# EasyEDA Pro project EVA_RT.eprj, board VISION_2_X12_4S_PCB
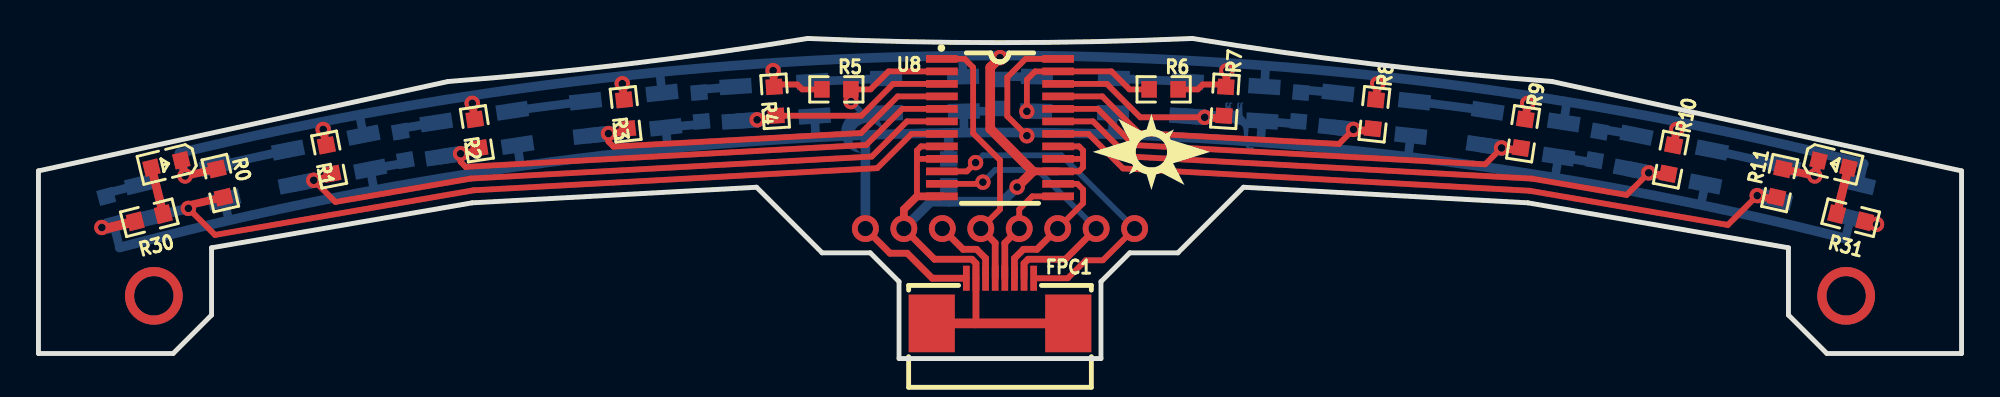
[diagram p4: board, top side]
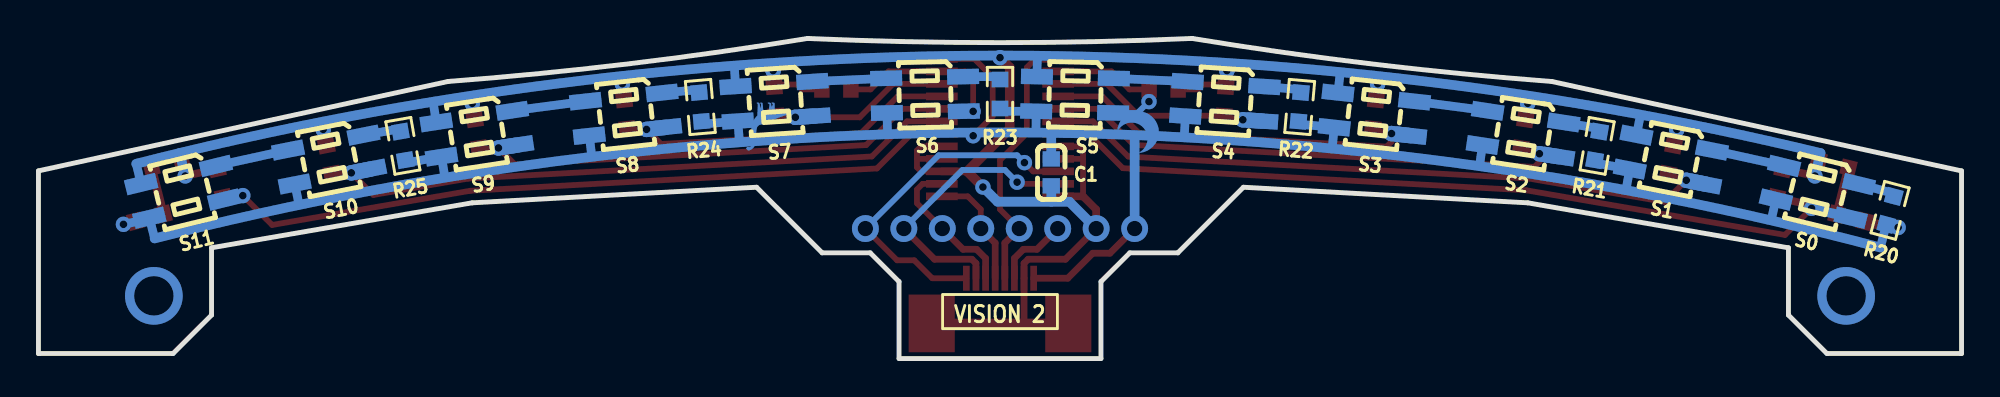
[diagram p5: board, bottom side, seen from below]

Outline 100 x 16.65 mm; copper layers: Top Layer, Bottom Layer. Coordinates in mm from the lower left corner of the outline.
Outline path: 0,0.26 0,9.76 21.3,14.41 arc(30.67,15.33) 40,16.65 arc(50,16.43) 60,16.65 arc(69.33,15.33) 78.7,14.41 100,9.76 100,0.26 93,0.26 91,2.26 91,5.76 77.45,8.1 62.66,8.91 59.25,5.5 56.75,5.5 55.25,4 55.25,0 44.75,0 44.75,4 43.25,5.5 40.75,5.5 37.34,8.91 22.55,8.1 9,5.76 9,2.26 7,0.26 0,0.26
Stack: Top Layer 0.035mm - / Dielectric1 1.51mm FR4 er 4.5 / Bottom Layer 0.035mm -

## Design rules (mm)
template: JLCPCB Capability(Two Layers Board)
spacing copperThickness1oz (default): track to track 0.102, other pairs 0.152 to 0.3
spacing copperThickness2oz: track to track 0.203, other pairs 0.152 to 0.3
track width copperThickness1oz (default): min 0.127, default 0.254, max 2.54
track width copperThickness2oz: min 0.203, default 0.254, max 2.54
differential pair differentialPair (default): width min 0.127, default 0.254, max 2.54; gap min 0.152, default 0.152
via viaSize (default): diameter min 0.5, default 0.61, max 10; hole min 0.3, default 0.305, max 6.3

## Placement (name value [footprint] x y rotation side)
C1  100nF  [C0603]  47.33 9.68 90 bottom
FPC1  FFC05001-08SBA124W5M  [FFC-SMD_FFC05001-08SBA124W5M]  50 3 0 top
LED1  XL-1608SURC-06  [LED0603-RD_RED]  6.65 10.12 193.7 top
LED2  XL-1608SURC-06  [LED0603-RD_RED]  93.34 10.11 346.3 top
R0  47kΩ  [R0603]  9.45 9.13 103.1 top
R1  47kΩ  [R0603]  15.11 10.35 101.2 top
R2  47kΩ  [R0603]  22.8 11.69 98.7 top
R3  47kΩ  [R0603]  30.53 12.71 96.2 top
R4  47kΩ  [R0603]  38.31 13.38 93.7 top
R5  47kΩ  [R0603]  41.49 14 180 top
R6  47kΩ  [R0603]  58.51 14 0 top
R7  47kΩ  [R0603]  61.69 13.38 86.3 top
R8  47kΩ  [R0603]  69.47 12.71 83.8 top
R9  47kΩ  [R0603]  77.2 11.69 81.3 top
R10  47kΩ  [R0603]  84.88 10.35 78.8 top
R11  47kΩ  [R0603]  90.55 9.13 77.6 top
R20  100Ω  [R0603]  3.72 7.71 104.9 bottom
R21  100Ω  [R0603]  18.95 11.06 99.9 bottom
R22  100Ω  [R0603]  34.42 13.09 95 bottom
R23  100Ω  [R0603]  50 13.76 90 bottom
R24  100Ω  [R0603]  65.58 13.09 85 bottom
R25  100Ω  [R0603]  81.05 11.06 80.1 bottom
R30  1kΩ  [R0603]  5.76 7.32 14.3 top
R31  1kΩ  [R0603]  94.23 7.32 165.7 top
S0  QRE1113GR  [OPTO-SMD_QRE1113GR]  7.5 8.67 13.7 bottom
S1  QRE1113GR  [OPTO-SMD_QRE1113GR]  15.11 10.35 11.2 bottom
S2  QRE1113GR  [OPTO-SMD_QRE1113GR]  22.8 11.69 8.7 bottom
S3  QRE1113GR  [OPTO-SMD_QRE1113GR]  30.53 12.71 6.2 bottom
S4  QRE1113GR  [OPTO-SMD_QRE1113GR]  38.31 13.38 3.7 bottom
S5  QRE1113GR  [OPTO-SMD_QRE1113GR]  46.1 13.72 1.2 bottom
S6  QRE1113GR  [OPTO-SMD_QRE1113GR]  53.9 13.72 358.8 bottom
S7  QRE1113GR  [OPTO-SMD_QRE1113GR]  61.69 13.38 356.3 bottom
S8  QRE1113GR  [OPTO-SMD_QRE1113GR]  69.47 12.71 353.8 bottom
S9  QRE1113GR  [OPTO-SMD_QRE1113GR]  77.2 11.69 351.3 bottom
S10  QRE1113GR  [OPTO-SMD_QRE1113GR]  84.88 10.35 348.8 bottom
S11  QRE1113GR  [OPTO-SMD_QRE1113GR]  92.5 8.67 346.3 bottom
U8  74HCT4067PW,118  [TSSOP-24_L7.8-W4.4-P0.65-LS6.4-BL]  50 12.01 270 top

## Footprints (pads in the part's own frame, mm; a bottom-side part is the same pattern mirrored in y, then rotated)
C0603
  rect 0.8x0.9 smd: 1(-0.7,0) 2(0.7,0)
FFC-SMD_FFC05001-08SBA124W5M
  rect 0.35x1.3 smd: 1(1.75,1.175) 2(1.25,1.175) 3(0.75,1.175) 4(0.25,1.175) 5(-0.25,1.175) 6(-0.75,1.175) 7(-1.25,1.175) 8(-1.75,1.175)
  rect 2.4x3 smd: 9(-3.55,-1.175) 10(3.55,-1.175)
LED0603-RD_RED
  rect 0.8x0.8 smd: 1(-0.799,-0.004) 2(0.799,0.004)
OPTO-SMD_QRE1113GR
  rect 1.66x0.8 smd: 1(-2,-0.9) 2(2,-0.9) 3(2,0.9) 4(-2,0.9)
R0603
  rect 0.806x0.864 smd: 1(-0.753,0) 2(0.753,0)
TSSOP-24_L7.8-W4.4-P0.65-LS6.4-BL
  rect 0.4x1.65 smd: 1(-3.575,-3.022) 2(-2.925,-3.022) 3(-2.275,-3.022) 4(-1.625,-3.022) 5(-0.975,-3.022) 6(-0.325,-3.022) 7(0.325,-3.022) 8(0.975,-3.022) 9(1.625,-3.022) 10(2.275,-3.022) 11(2.925,-3.022) 12(3.575,-3.022) 13(3.575,3.022) 14(2.925,3.022) 15(2.275,3.022) 16(1.625,3.022) 17(0.975,3.022) 18(0.325,3.022) 19(-0.325,3.022) 20(-0.975,3.022) 21(-1.625,3.022) 22(-2.275,3.022) 23(-2.925,3.022) 24(-3.575,3.022)

## Nets
As in the schematic.

## Via types
v1: diameter 3, hole 2.05, Top Layer to Bottom Layer, 2 vias
v2: diameter 0.8, hole 0.4, Top Layer to Bottom Layer, 29 vias
v3: diameter 1.4, hole 0.8, Top Layer to Bottom Layer, 8 vias

## Routing (per net, layer and track width the routed paths; a pad name or vN(x,y) marks a point on that pad's centre or on a via; arc(x,y) is an arc through that point)
+5V: length 136.8
  Top Layer w0.3: U8.24 51.33,15.59 50.38,14.64 50.38,12.6 v2(51.4,11.59)
  Top Layer w0.35: v3(43,6.76) 44.28,5.48 45.17,5.48 46.47,4.18 FPC1.8
  Top Layer w0.5: R30.1 3.38,6.73
  Bottom Layer w0.45: 17.45,8.76 S1.3 19.1,10.18 ; 48.13,11.75 48.12,12.86 ; 65.51,12.19 S7.3 63.55,11.25 ; 86.45,7.99 S10.3 ; 32.73,10.92 S3.3 34.49,12.19 ; v2(95.58,6.98) 94.22,7.26 ; 94.22,7.26 S11.3 ; 94.22,7.26 93.96,6.25 ; 78.86,9.41 79.04,10.5 80.9,10.18 ; 55.84,11.67 S6.3 ; 71.22,10.49 S8.3 ; R20.1 4.22,5.77 ; 40.42,11.5 S4.3 ; 25.07,10.01 S2.3 ; S5.3 50,12.86 ; 9.9,7.19 S0.3
  Bottom Layer w0.5: 4.22,5.77 arc(49.06,11.76) 93.96,6.25 ; 47.33,10.38 47.33,11.71 ; 43.01,11.59 43,11.57 v3(43,6.76)
  vias: v2(3.3,6.82)
GND: length 161.7
  Top Layer w0.3: 61.74,14.13 61.62,14.25 60.54,14.25 60.29,14 R6.2 ; U8.8 45.89,11.04 45.68,10.83 45.68,10.39 ; 45.68,10.39 U8.9 ; 45.68,10.39 45.68,8.44 ; U8.17 54.11,11.04 54.32,10.83 54.32,10.39 ; 54.32,10.39 U8.16 ; 54.32,10.39 54.32,9.95 54.11,9.74 U8.15 ; 38.26,14.13 38.38,14.25 39.46,14.25 39.71,14 R5.2
  Top Layer w0.35: v3(45,6.76) 46.6,5.17 48.54,5.17 48.75,4.95 FPC1.7 48.75,1.83
  Top Layer w0.4: 51.71,9.74 U8.15 ; R0.2 v2(7.62,9.5) LED1.1 ; v2(38.2,14.98) 38.26,14.03 ; v2(30.36,14.3) 30.46,13.36 ; v3(45,6.76) 45,7.75 45.68,8.44 U8.12 ; 77.31,12.44 v2(77.44,13.28) ; R10.2 v2(85.19,11.92) ; LED2.1 v2(92.37,9.5) R11.2 ; v2(22.56,13.28) 22.7,12.34 ; 61.74,14.13 v2(61.8,14.98) ; v2(14.81,11.92) 14.99,10.99 ; R8.2 v2(69.64,14.3)
  Top Layer w0.5: v2(50.89,8.92) 51.71,9.74 49.49,11.95 49.49,15.14 v2(50,15.65) ; FPC1.10 FPC1.9
  Bottom Layer w0.45: S9.2 79.48,13.36 ; S3.2 32.31,14.9 ; S7.2 63.82,15.24 ; S5.2 48.06,15.75 ; S1.2 16.69,12.69 ; S11.2 94.92,10.13
  Bottom Layer w0.5: 94.92,10.13 arc(51.16,15.76) 7.33,10.69 v2(7.62,9.5) ; C1.1 47.33,8.16 ; 47.33,8.16 50.13,8.16 v2(50.89,8.92) ; 47.33,8.16 46.4,8.16 v3(45,6.76) ; v2(92.37,9.5) 92.66,10.69
  Bottom Layer w0.8: v2(14.81,11.92) 14.77,12.11 ; v2(77.44,13.28) 77.47,13.47 ; v2(38.2,14.98) 38.19,15.18 ; v2(69.64,14.3) 69.66,14.5 ; v2(30.36,14.3) 30.34,14.5 ; v2(85.19,11.92) 85.23,12.11 ; v2(61.8,14.98) 61.81,15.18 ; v2(22.56,13.28) 22.53,13.47
(no net):
  vias: v1(6,3.26) v1(94,3.26)
$LED1_2: length 2.5
  Top Layer w0.45: R30.2 LED1.2
$LED2_2: length 2.5
  Top Layer w0.45: R31.2 94.12,9.92
$R20_2: length 1.9
  Bottom Layer w0.45: S0.1 3.48,8.58
$R21_2: length 1.9
  Bottom Layer w0.45: S2.1 18.79,11.95
$R22_2: length 1.9
  Bottom Layer w0.45: S4.1 34.34,13.98
$R23_2: length 1.9
  Bottom Layer w0.45: S6.1 50,14.66
$R24_2: length 1.9
  Bottom Layer w0.45: S8.1 65.66,13.98
$R25_2: length 1.9
  Bottom Layer w0.45: S10.1 81.21,11.95
$S0_2: length 3.8
  Bottom Layer w0.45: S0.2 S1.1
$S2_2: length 3.8
  Bottom Layer w0.45: S2.2 28.45,13.38
$S4_2: length 3.8
  Bottom Layer w0.45: S4.2 S5.1
$S6_2: length 3.8
  Bottom Layer w0.45: S6.2 59.76,14.41
$S8_2: length 3.8
  Bottom Layer w0.45: 71.55,13.38 S9.1
$S10_2: length 3.8
  Bottom Layer w0.45: S10.2 S11.1
C0: length 14.1
  Top Layer w0.3: U8.1 48.16,15.59 48.6,15.14 48.6,11.71 50,10.32 50,7.76 v3(49,6.76)
  Top Layer w0.35: v3(49,6.76) 49.75,6.01 FPC1.5
P6: length 3.9
  Top Layer w0.35: FPC1.6 49.25,5.21 48.78,5.68 48.08,5.68 v3(47,6.76)
S0: length 18.3
  Top Layer w0.3: FPC1.1 53.53,4.18 54.46,5.11 55.35,5.11 v3(57,6.76) ; v2(48.73,10.19) 48.28,9.74 U8.10
  Bottom Layer w0.3: v2(48.73,10.19) 49.11,10.57 53.19,10.57 v3(57,6.76)
S1: length 14.9
  Top Layer w0.3: v2(49.11,9.17) 49.02,9.09 U8.11
  Top Layer w0.35: v3(55,6.76) 53.4,5.17 51.46,5.17 51.25,4.95 FPC1.2
  Bottom Layer w0.3: v3(55,6.76) 51.95,9.81 49.75,9.81 v2(49.11,9.17)
S2: length 7.9
  Top Layer w0.3: v3(53,6.76) 54.32,8.08 54.32,8.79 54.03,9.09 U8.14
  Top Layer w0.35: v3(53,6.76) 51.92,5.68 51.22,5.68 50.75,5.21 FPC1.3
S3: length 6.2
  Top Layer w0.3: v3(51,6.76) 51,7.76 51.68,8.44 U8.13
  Top Layer w0.35: FPC1.4 50.25,6.01 v3(51,6.76)
Y0: length 44.2
  Top Layer w0.3: U8.7 45.4,11.69 43.62,9.9 22.63,8.75 9.18,6.43 v2(7.8,7.81)
  Top Layer w0.4: 7.9,7.99 R0.1
  Bottom Layer w0.5: 6.14,7.42 v2(7.8,7.81)
Y1: length 36
  Top Layer w0.3: U8.6 45.16,12.34 43.33,10.51 22.49,9.36 15.44,8.15 v2(14.31,9.27)
  Top Layer w0.4: v2(14.31,9.27) 15.29,9.47
  Bottom Layer w0.8: S1.4 v2(14.31,9.27)
Y2: length 28.4
  Top Layer w0.3: U8.5 44.92,12.99 43.05,11.11 22.21,9.97 21.95,10.23 v2(21.95,10.65)
  Top Layer w0.4: v2(21.95,10.65) 22.94,10.8
  Bottom Layer w0.8: 20.96,10.5 v2(21.95,10.65)
Y3: length 20.7
  Top Layer w0.3: U8.4 44.68,13.64 42.78,11.73 29.9,11.02 29.64,11.28 v2(29.64,11.7)
  Top Layer w0.4: v2(29.64,11.7) 30.63,11.81
  Bottom Layer w0.8: S3.4 v2(29.64,11.7)
Y4: length 11.3
  Top Layer w0.3: 38.35,12.63 42.79,12.63 44.44,14.29 U8.3
  Top Layer w0.4: v2(37.37,12.42) 38.36,12.48
  Bottom Layer w0.8: S4.4 v2(37.37,12.42)
Y5: length 7.2
  Top Layer w0.3: U8.2 44.21,14.94 43.27,14 R5.1
  Bottom Layer w0.3: v2(42.25,13.37) 42.84,12.78 S5.4
Y6: length 8.6
  Top Layer w0.3: R6.1 56.73,14 55.79,14.94 U8.23 51.82,14.94 51.4,14.51 v2(51.4,12.86)
Y7: length 10.3
  Top Layer w0.3: U8.22 55.56,14.29 57.29,12.55 v2(60.64,12.55)
  Top Layer w0.4: v2(60.64,12.55) 61.64,12.48
  Bottom Layer w0.8: S7.4 v2(60.64,12.55)
Y8: length 18.5
  Top Layer w0.3: v2(68.38,11.92) 67.62,11.16 57.22,11.73 55.32,13.64 U8.21
  Top Layer w0.4: v2(68.38,11.92) 69.37,11.81
  Bottom Layer w0.8: S8.4 v2(68.38,11.92)
Y9: length 26.2
  Top Layer w0.3: U8.20 55.08,12.99 56.96,11.1 75.23,10.1 v2(76.08,10.95)
  Top Layer w0.4: v2(76.08,10.95) 77.06,10.8
  Bottom Layer w0.8: S9.4 v2(76.08,10.95)
Y10: length 34
  Top Layer w0.3: U8.19 54.84,12.34 56.66,10.51 77.65,9.36 82.59,8.51 v2(83.73,9.66)
  Top Layer w0.4: v2(83.73,9.66) 84.71,9.47
  Bottom Layer w0.8: S10.4 v2(83.73,9.66)
Y11: length 38.9
  Top Layer w0.3: v2(89.37,8.48) 87.85,6.95 77.54,8.73 56.4,9.89 54.6,11.69 U8.18
  Top Layer w0.4: v2(89.37,8.48) 90.34,8.25

Small or netless copper shapes (teardrops, artwork), in the pictures only: 2 on Bottom Layer

## Text on the board
Bottom Silkscreen Layer: VISION 2
